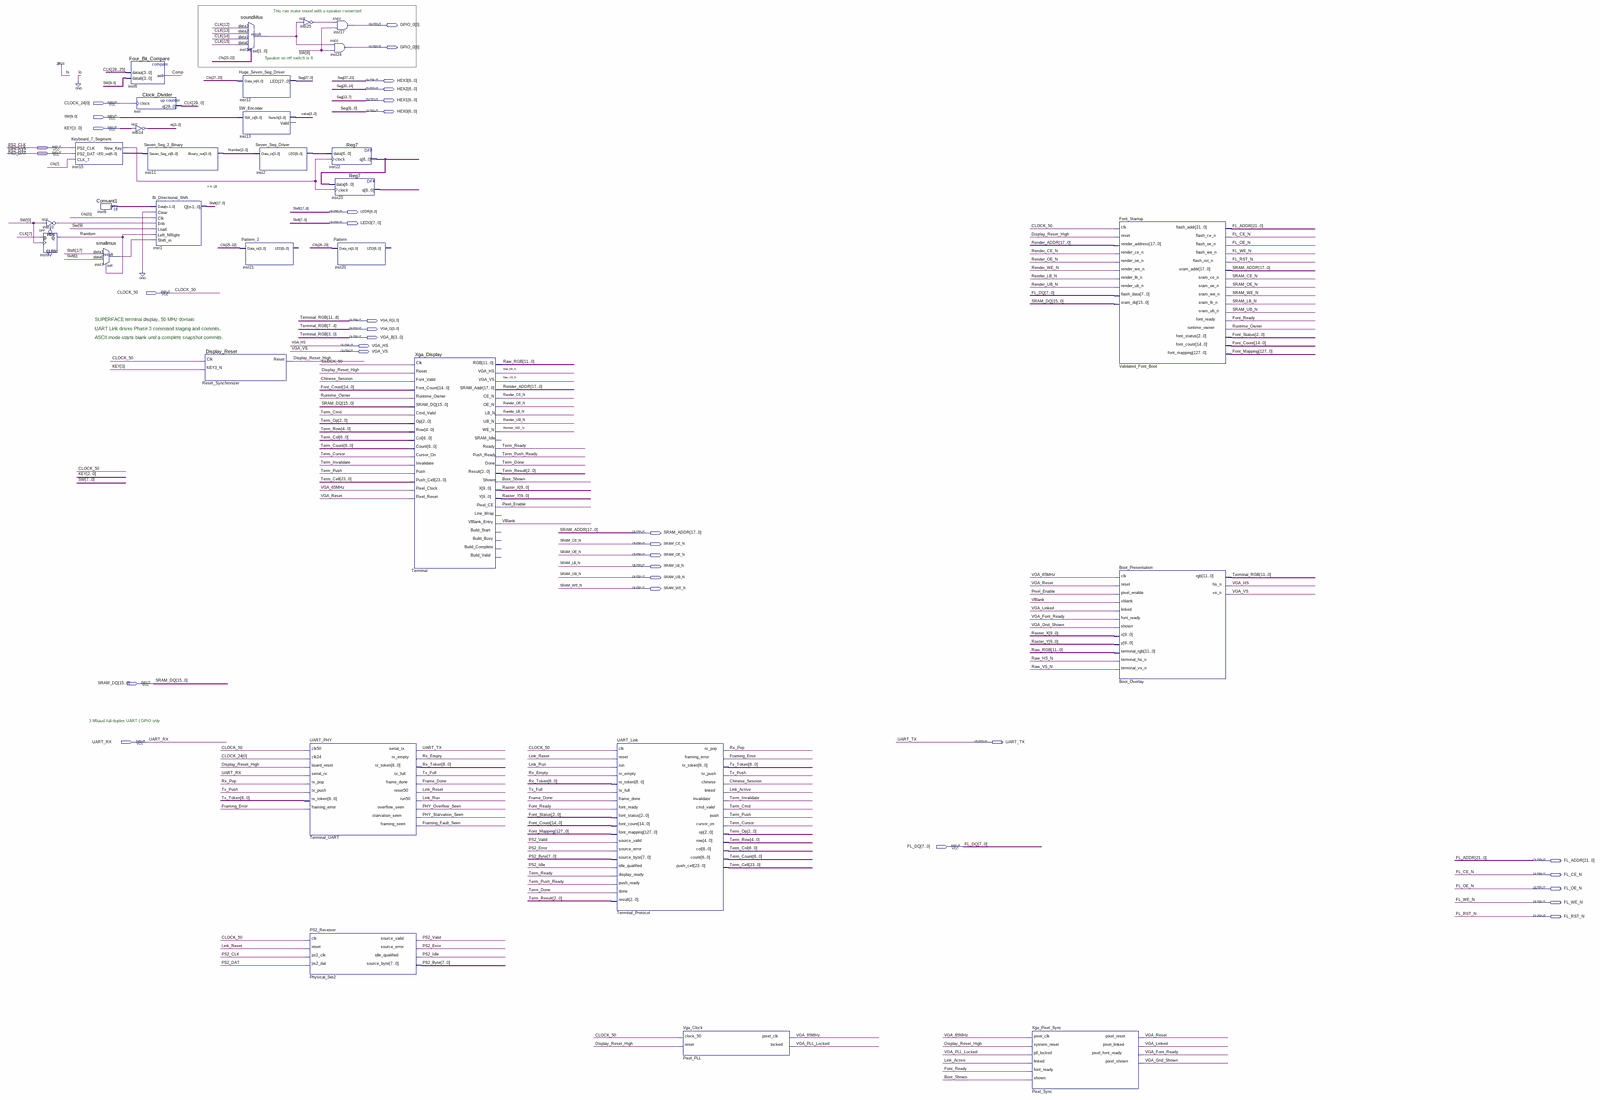
[diagram p0: schematic sheet, whole]
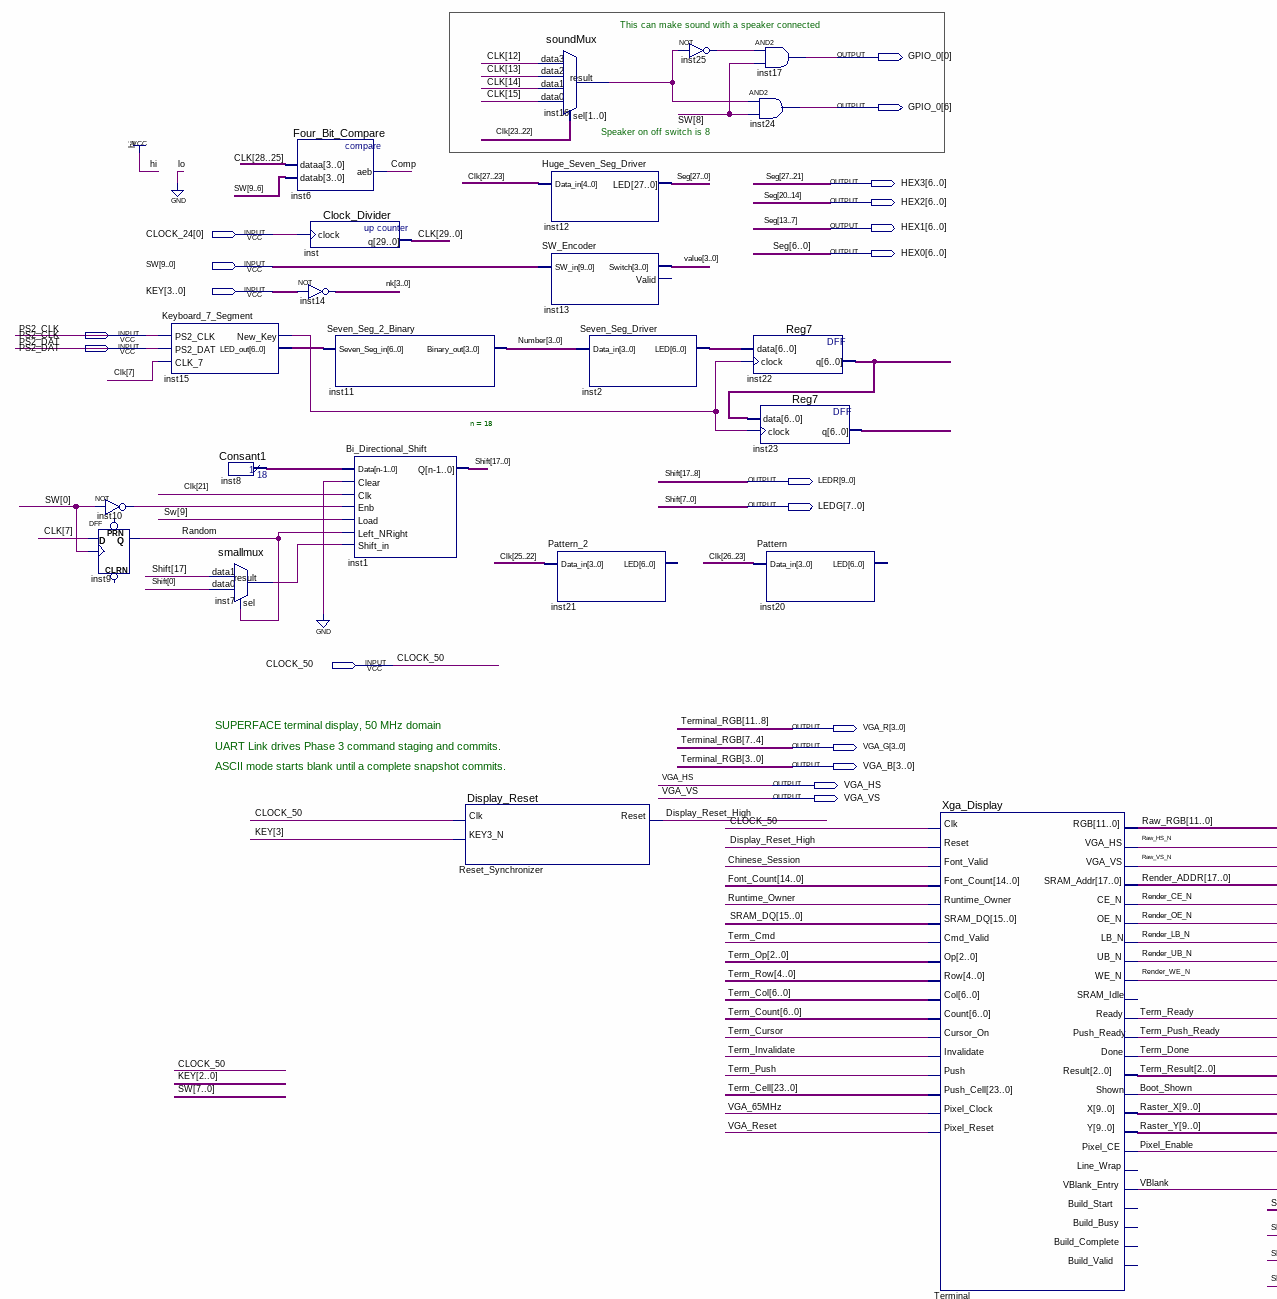
[diagram p1: schematic sheet, upper left part]
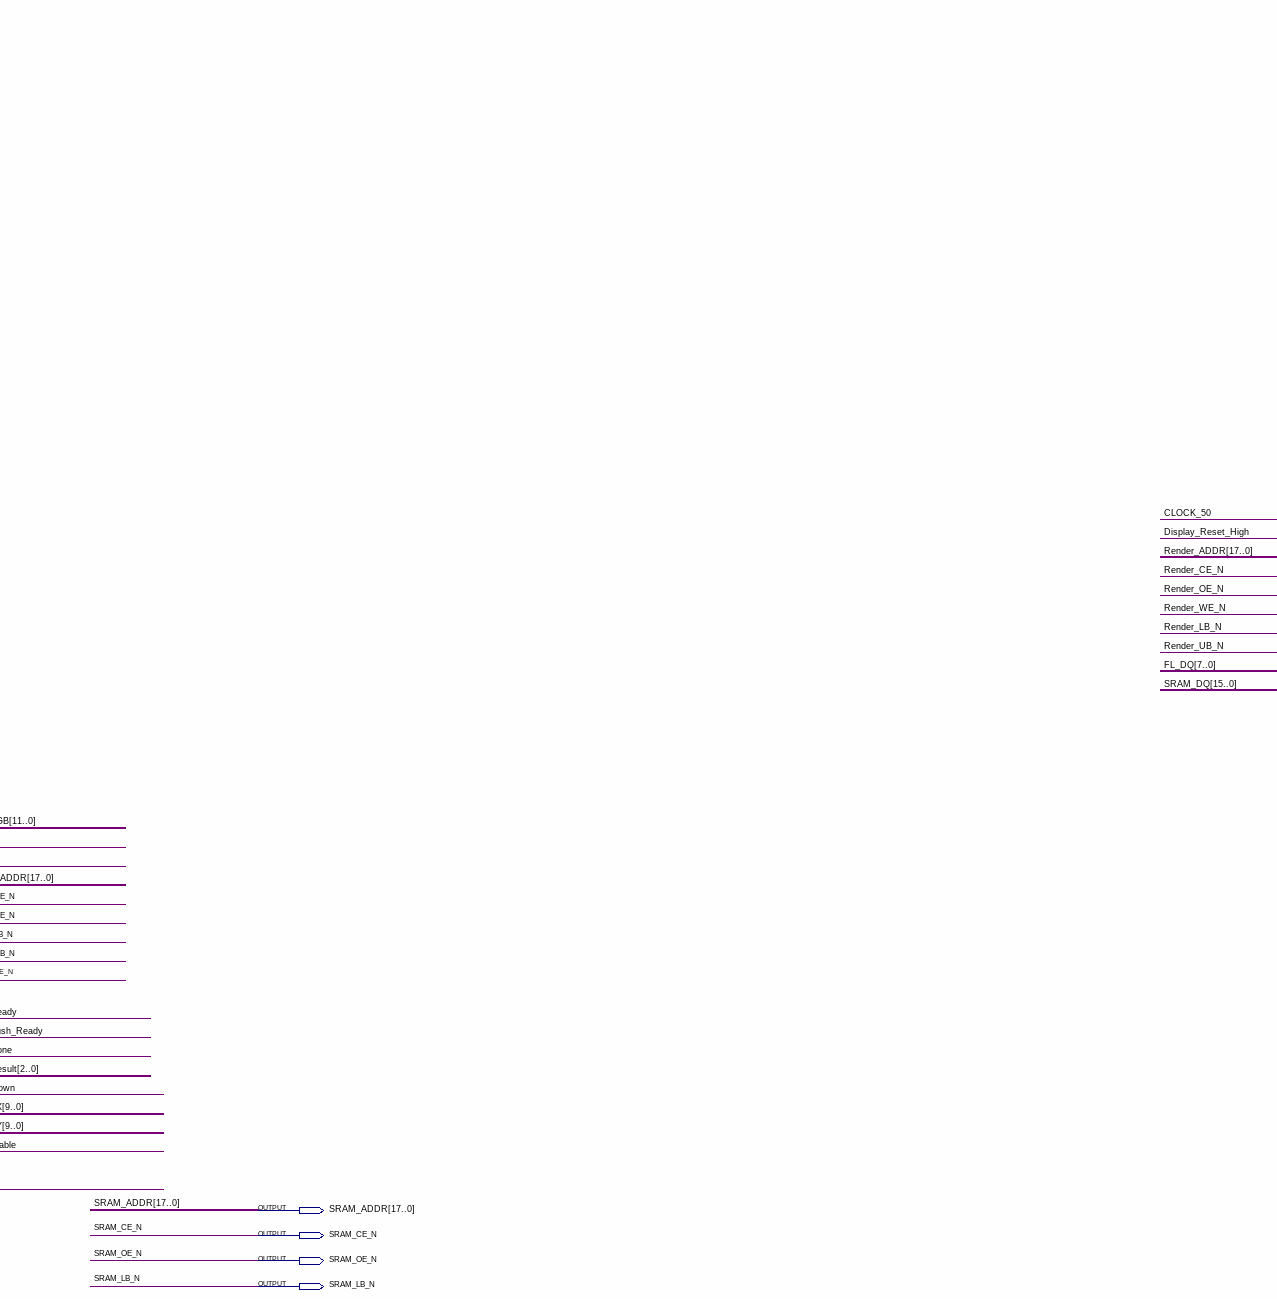
[diagram p2: schematic sheet, upper centre part]
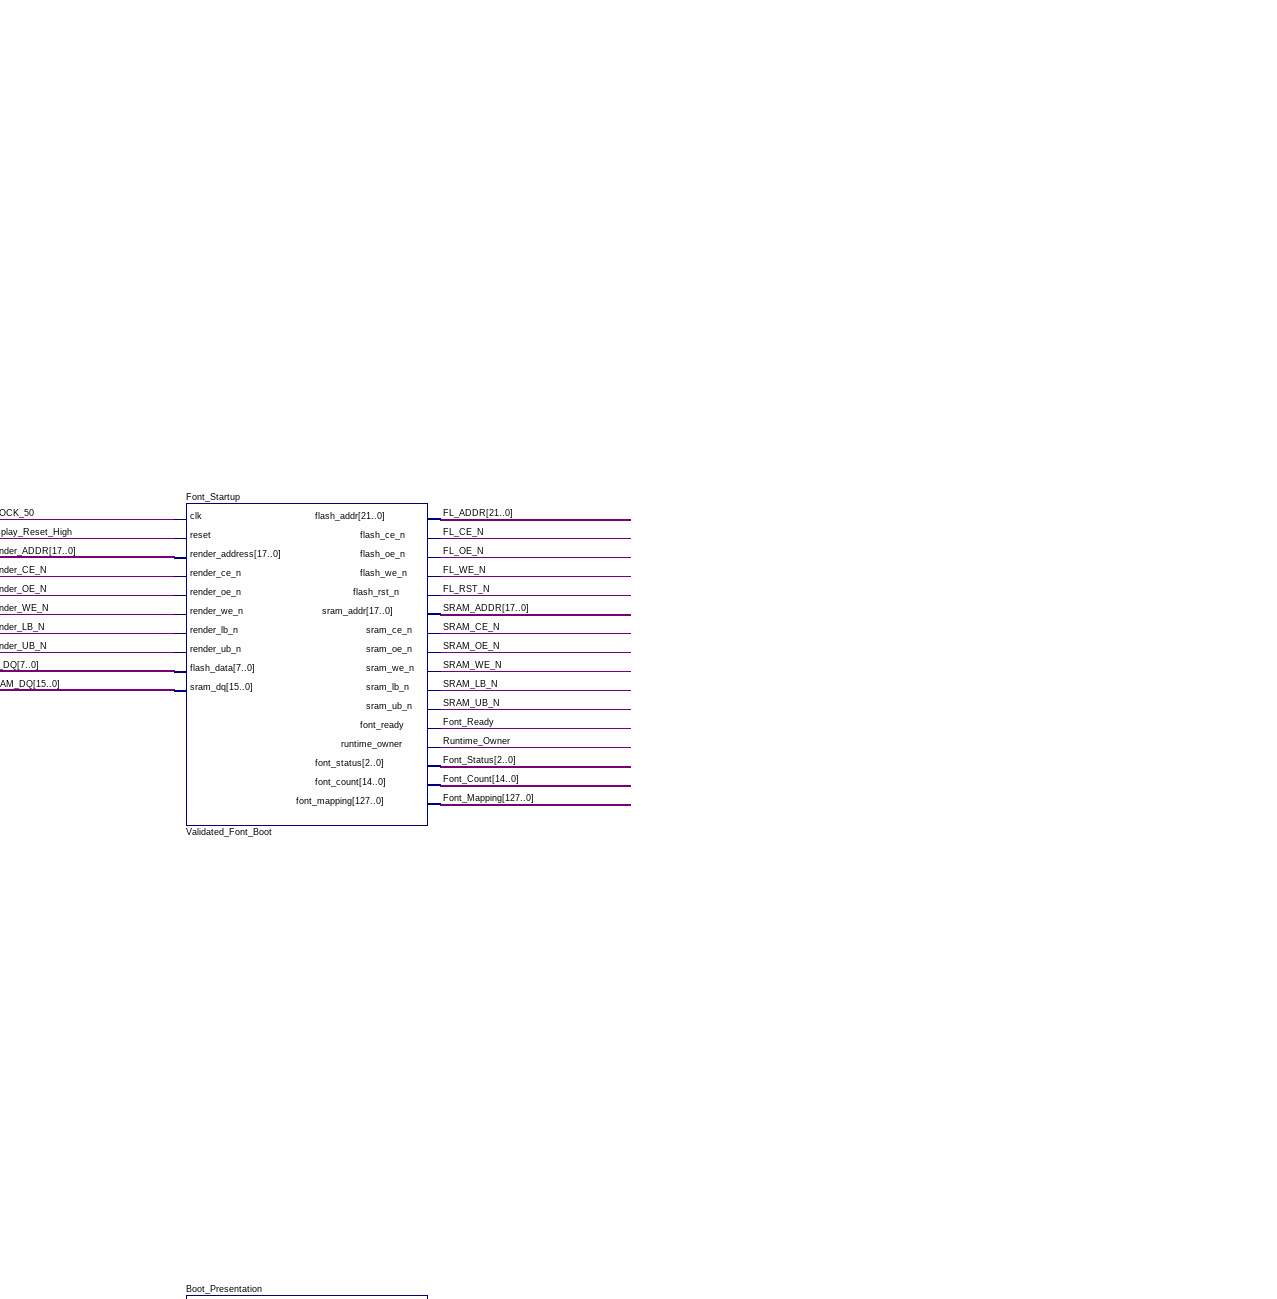
[diagram p3: schematic sheet, upper right part]
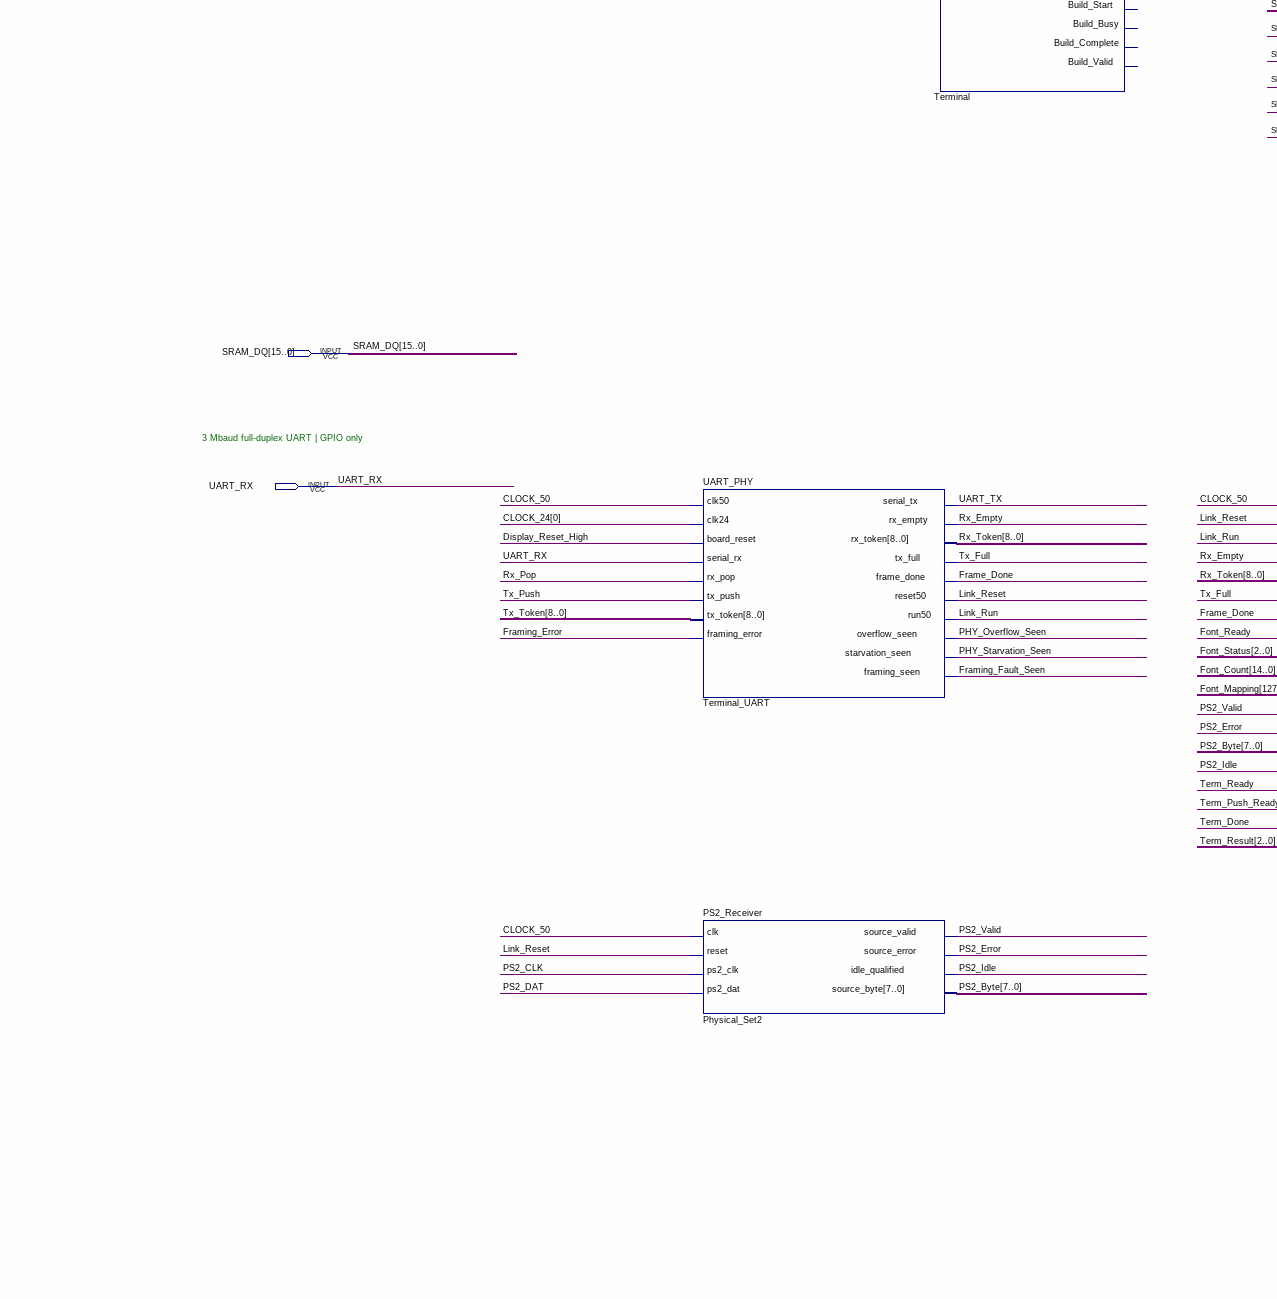
[diagram p4: schematic sheet, lower left part]
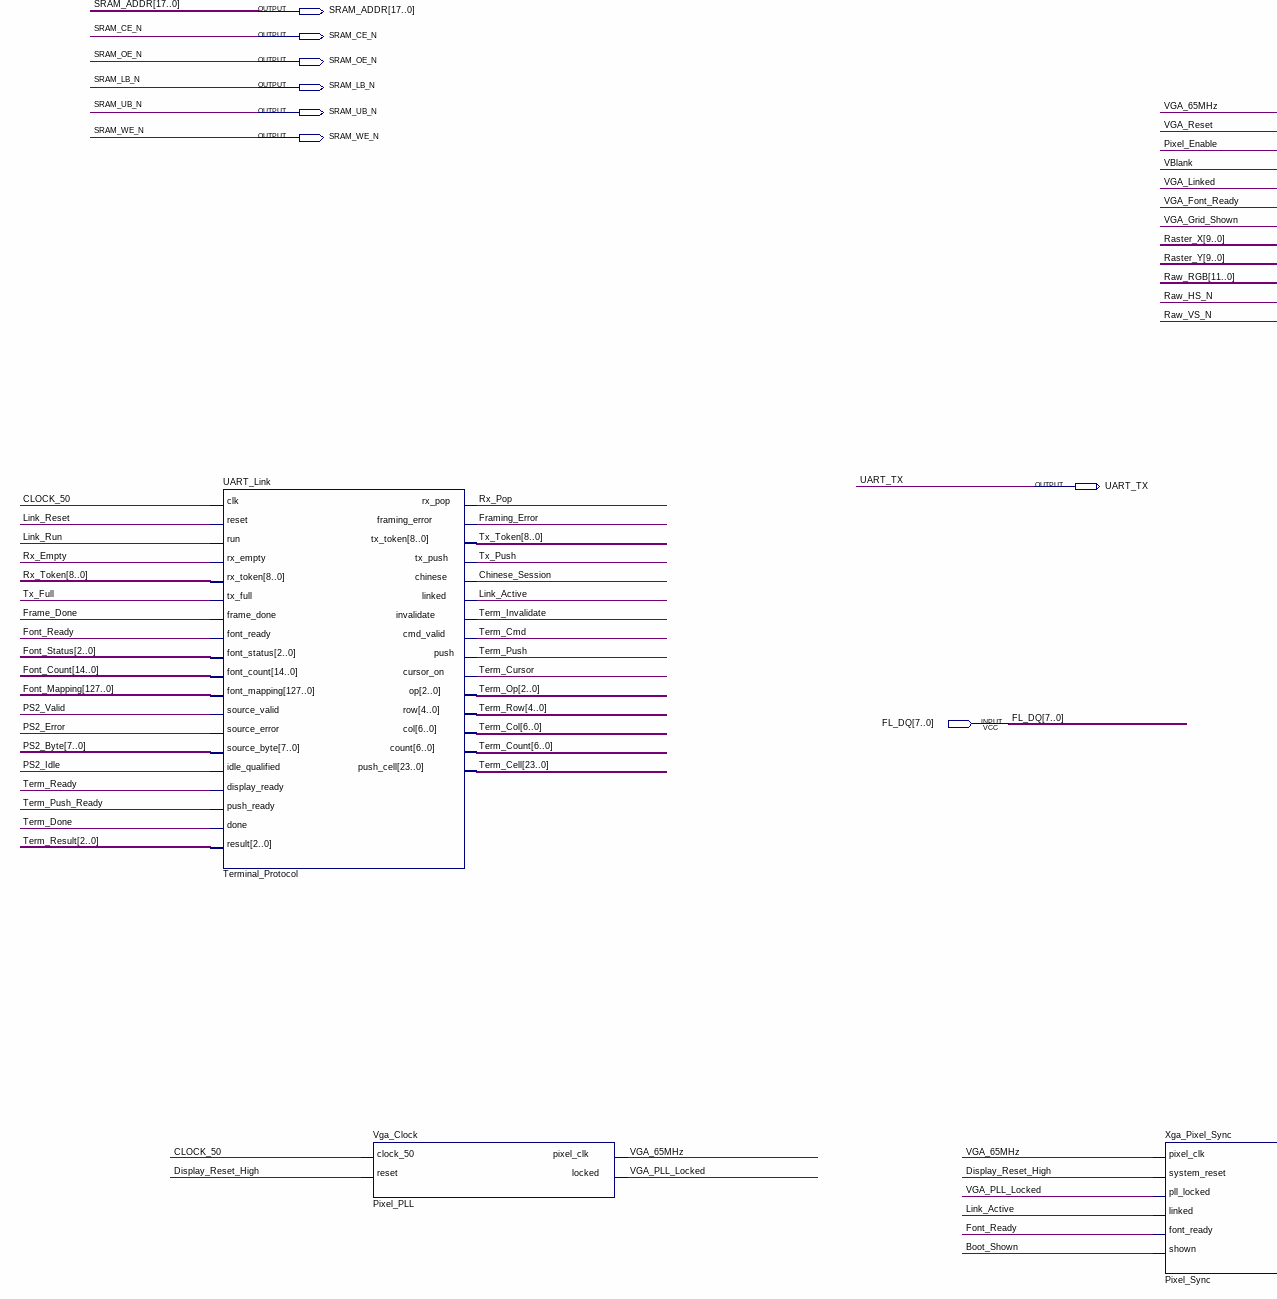
[diagram p5: schematic sheet, lower centre part]
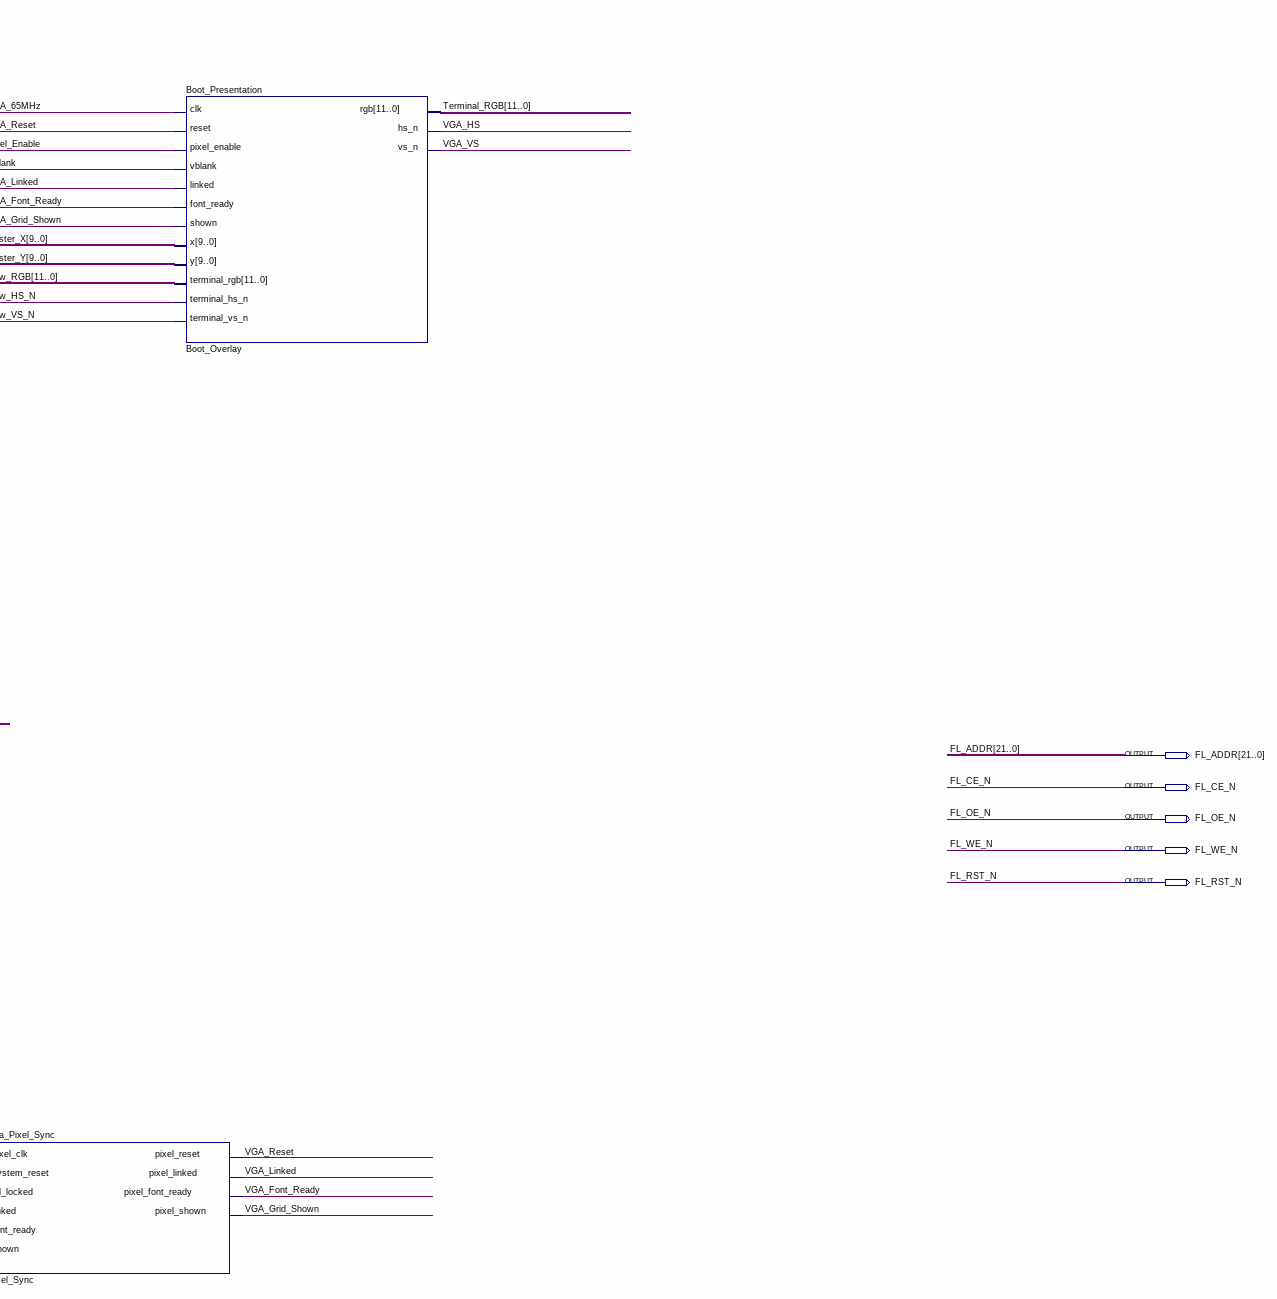
[diagram p6: schematic sheet, lower right part]
// Quartus schematic LAB8.bdf as structural Verilog: 30 symbols, 34 pins
module LAB8 (
  input  [0:0] CLOCK_24,
  input  [9:0] SW,
  input  [3:0] KEY,
  input  PS2_CLK,
  input  PS2_DAT,
  input  CLOCK_50,
  input  UART_RX,
  input  [7:0] FL_DQ,
  inout  [15:0] SRAM_DQ,
  output [6:0] GPIO_0,
  output [6:0] HEX3,
  output [6:0] HEX2,
  output [6:0] HEX1,
  output [6:0] HEX0,
  output [9:0] LEDR,
  output [7:0] LEDG,
  output [3:0] VGA_R,
  output [3:0] VGA_G,
  output [3:0] VGA_B,
  output VGA_HS,
  output VGA_VS,
  output [17:0] SRAM_ADDR,
  output SRAM_CE_N,
  output SRAM_OE_N,
  output SRAM_LB_N,
  output SRAM_UB_N,
  output SRAM_WE_N,
  output UART_TX,
  output [21:0] FL_ADDR,
  output FL_CE_N,
  output FL_OE_N,
  output FL_WE_N,
  output FL_RST_N
);

  wire Boot_Shown, Chinese_Session, Comp, Display_Reset_High, Font_Ready, Frame_Done, Framing_Error,
       Framing_Fault_Seen, inst7_result, inst10_out, inst15_new_key, inst16_result, inst25_out, Link_Active,
       Link_Reset, Link_Run, PHY_Overflow_Seen, PHY_Starvation_Seen, Pixel_Enable, PS2_Error, PS2_Idle,
       PS2_Valid, Random, Raw_HS_N, Raw_VS_N, Render_CE_N, Render_LB_N, Render_OE_N, Render_UB_N,
       Render_WE_N, Runtime_Owner, Rx_Empty, Rx_Pop, Term_Cmd, Term_Cursor, Term_Done, Term_Invalidate,
       Term_Push, Term_Push_Ready, Term_Ready, Tx_Full, Tx_Push, VBlank, VGA_65MHz, VGA_Font_Ready,
       VGA_Grid_Shown, VGA_Linked, VGA_PLL_Locked, VGA_Reset;
  wire [2:0] Font_Status, Term_Op, Term_Result;
  wire [3:0] nk, Number, value;
  wire [4:0] Term_Row;
  wire [6:0] inst2_led, inst15_led_out, inst22_q, inst23_q, Term_Col, Term_Count;
  wire [7:0] PS2_Byte;
  wire [8:0] Rx_Token, Tx_Token;
  wire [9:0] Raster_X, Raster_Y;
  wire [11:0] Raw_RGB;
  wire [14:0] Font_Count;
  wire [17:0] inst8_result, Render_ADDR;
  wire [23:0] Term_Cell;
  wire [29:0] CLK;
  wire [127:0] Font_Mapping;

  not inst10 (inst10_out, SW[0]);
  DFF inst9 (.CLK(SW[0]), .D(CLK[7]), .Q(Random));  // open: CLRN, PRN
  Keyboard_7_Segment inst15 (
    .PS2_CLK(PS2_CLK), .PS2_DAT(PS2_DAT), .CLK_7(CLK[7]), .New_Key(inst15_new_key), .LED_out(inst15_led_out));
  Consant1 inst8 (.result(inst8_result));
  smallmux inst7 (.data1(LEDR[9]), .data0(LEDG[0]), .sel(Random), .result(inst7_result));
  Four_Bit_Compare inst6 (.dataa(CLK[28:25]), .datab(SW[9:6]), .aeb(Comp));
  Clock_Divider inst (.clock(CLOCK_24[0]), .q(CLK));
  assign nk = ~KEY;  // NOT inst14, 4 bits wide
  Seven_Seg_2_Binary inst11 (.Seven_Seg_in(inst15_led_out), .Binary_out(Number));
  Bi_Directional_Shift #(.n(18)) inst1 (
    .Data(inst8_result), .Clear(1'b0), .Clk(CLK[21]), .Enb(inst10_out), .Load(SW[9]), .Left_NRight(Random),
    .Shift_in(inst7_result), .Q({LEDR, LEDG}));
  Display_Reset Reset_Synchronizer (.Clk(CLOCK_50), .KEY3_N(KEY[3]), .Reset(Display_Reset_High));
  soundMux inst16 (
    .data3(CLK[12]), .data2(CLK[13]), .data1(CLK[14]), .data0(CLK[15]), .sel(CLK[23:22]),
    .result(inst16_result));
  Huge_Seven_Seg_Driver inst12 (.Data_in(CLK[27:23]), .LED({HEX3, HEX2, HEX1, HEX0}));
  SW_Encoder inst13 (.SW_in(SW), .Switch(value));  // open: Valid
  Pattern_2 inst21 (.Data_in(CLK[25:22]));  // open: LED
  Seven_Seg_Driver inst2 (.Data_in(Number), .LED(inst2_led));
  not inst25 (inst25_out, inst16_result);
  UART_PHY Terminal_UART (
    .clk50(CLOCK_50), .clk24(CLOCK_24[0]), .board_reset(Display_Reset_High), .serial_rx(UART_RX),
    .rx_pop(Rx_Pop), .tx_push(Tx_Push), .tx_token(Tx_Token), .framing_error(Framing_Error),
    .serial_tx(UART_TX), .rx_empty(Rx_Empty), .rx_token(Rx_Token), .tx_full(Tx_Full),
    .frame_done(Frame_Done), .reset50(Link_Reset), .run50(Link_Run), .overflow_seen(PHY_Overflow_Seen),
    .starvation_seen(PHY_Starvation_Seen), .framing_seen(Framing_Fault_Seen));
  PS2_Receiver Physical_Set2 (
    .clk(CLOCK_50), .reset(Link_Reset), .ps2_clk(PS2_CLK), .ps2_dat(PS2_DAT), .source_valid(PS2_Valid),
    .source_error(PS2_Error), .idle_qualified(PS2_Idle), .source_byte(PS2_Byte));
  and inst17 (GPIO_0[0], inst25_out, SW[8]);
  and inst24 (GPIO_0[6], inst16_result, SW[8]);
  Reg7 inst22 (.data(inst2_led), .clock(inst15_new_key), .q(inst22_q));
  Reg7 inst23 (.data(inst22_q), .clock(inst15_new_key), .q(inst23_q));
  Pattern inst20 (.Data_in(CLK[26:23]));  // open: LED
  Xga_Display Terminal (
    .Clk(CLOCK_50), .Reset(Display_Reset_High), .Font_Valid(Chinese_Session), .Font_Count(Font_Count),
    .Runtime_Owner(Runtime_Owner), .SRAM_DQ(SRAM_DQ), .Cmd_Valid(Term_Cmd), .Op(Term_Op), .Row(Term_Row),
    .Col(Term_Col), .Count(Term_Count), .Cursor_On(Term_Cursor), .Invalidate(Term_Invalidate),
    .Push(Term_Push), .Push_Cell(Term_Cell), .Pixel_Clock(VGA_65MHz), .Pixel_Reset(VGA_Reset), .RGB(Raw_RGB),
    .VGA_HS(Raw_HS_N), .VGA_VS(Raw_VS_N), .SRAM_Addr(Render_ADDR), .CE_N(Render_CE_N), .OE_N(Render_OE_N),
    .LB_N(Render_LB_N), .UB_N(Render_UB_N), .WE_N(Render_WE_N), .Ready(Term_Ready),
    .Push_Ready(Term_Push_Ready), .Done(Term_Done), .Result(Term_Result), .Shown(Boot_Shown), .X(Raster_X),
    .Y(Raster_Y), .Pixel_CE(Pixel_Enable), .VBlank_Entry(VBlank));  // open: SRAM_Idle, Line_Wrap, Build_Start, Build_Busy, Build_Complete, Build_Valid
  UART_Link Terminal_Protocol (
    .clk(CLOCK_50), .reset(Link_Reset), .run(Link_Run), .rx_empty(Rx_Empty), .rx_token(Rx_Token),
    .tx_full(Tx_Full), .frame_done(Frame_Done), .font_ready(Font_Ready), .font_status(Font_Status),
    .font_count(Font_Count), .font_mapping(Font_Mapping), .source_valid(PS2_Valid), .source_error(PS2_Error),
    .source_byte(PS2_Byte), .idle_qualified(PS2_Idle), .display_ready(Term_Ready),
    .push_ready(Term_Push_Ready), .done(Term_Done), .result(Term_Result), .rx_pop(Rx_Pop),
    .framing_error(Framing_Error), .tx_token(Tx_Token), .tx_push(Tx_Push), .chinese(Chinese_Session),
    .linked(Link_Active), .invalidate(Term_Invalidate), .cmd_valid(Term_Cmd), .push(Term_Push),
    .cursor_on(Term_Cursor), .op(Term_Op), .row(Term_Row), .col(Term_Col), .count(Term_Count),
    .push_cell(Term_Cell));
  Vga_Clock Pixel_PLL (.clock_50(CLOCK_50), .reset(Display_Reset_High), .pixel_clk(VGA_65MHz), .locked(VGA_PLL_Locked));
  Xga_Pixel_Sync Pixel_Sync (
    .pixel_clk(VGA_65MHz), .system_reset(Display_Reset_High), .pll_locked(VGA_PLL_Locked),
    .linked(Link_Active), .font_ready(Font_Ready), .shown(Boot_Shown), .pixel_reset(VGA_Reset),
    .pixel_linked(VGA_Linked), .pixel_font_ready(VGA_Font_Ready), .pixel_shown(VGA_Grid_Shown));
  Font_Startup Validated_Font_Boot (
    .clk(CLOCK_50), .reset(Display_Reset_High), .render_address(Render_ADDR), .render_ce_n(Render_CE_N),
    .render_oe_n(Render_OE_N), .render_we_n(Render_WE_N), .render_lb_n(Render_LB_N),
    .render_ub_n(Render_UB_N), .flash_data(FL_DQ), .sram_dq(SRAM_DQ), .flash_addr(FL_ADDR),
    .flash_ce_n(FL_CE_N), .flash_oe_n(FL_OE_N), .flash_we_n(FL_WE_N), .flash_rst_n(FL_RST_N),
    .sram_addr(SRAM_ADDR), .sram_ce_n(SRAM_CE_N), .sram_oe_n(SRAM_OE_N), .sram_we_n(SRAM_WE_N),
    .sram_lb_n(SRAM_LB_N), .sram_ub_n(SRAM_UB_N), .font_ready(Font_Ready), .runtime_owner(Runtime_Owner),
    .font_status(Font_Status), .font_count(Font_Count), .font_mapping(Font_Mapping));
  Boot_Presentation Boot_Overlay (
    .clk(VGA_65MHz), .reset(VGA_Reset), .pixel_enable(Pixel_Enable), .vblank(VBlank), .linked(VGA_Linked),
    .font_ready(VGA_Font_Ready), .shown(VGA_Grid_Shown), .x(Raster_X), .y(Raster_Y), .terminal_rgb(Raw_RGB),
    .terminal_hs_n(Raw_HS_N), .terminal_vs_n(Raw_VS_N), .rgb({VGA_R, VGA_G, VGA_B}), .hs_n(VGA_HS),
    .vs_n(VGA_VS));

  // Other names for the same wires on the sheet: Seg[27:0] = {HEX3, HEX2, HEX1, HEX0}; Shift[17:0] = {LEDR, LEDG};
  //   Terminal_RGB[11:0] = {VGA_R, VGA_G, VGA_B}

  // Notes on the sheet:
  //   This can make sound with a speaker connected
  //   Speaker on off switch is 8
  //   SUPERFACE terminal display, 50 MHz domain
  //   UART Link drives Phase 3 command staging and commits.
  //   ASCII mode starts blank until a complete snapshot commits.
  //   3 Mbaud full-duplex UART | GPIO only
endmodule
